# EasyEDA Pro project ProPrj_ROV_MINI_CTRL_2026-11-13.epro, board ROV_MINI_CTRL_V2.0.0
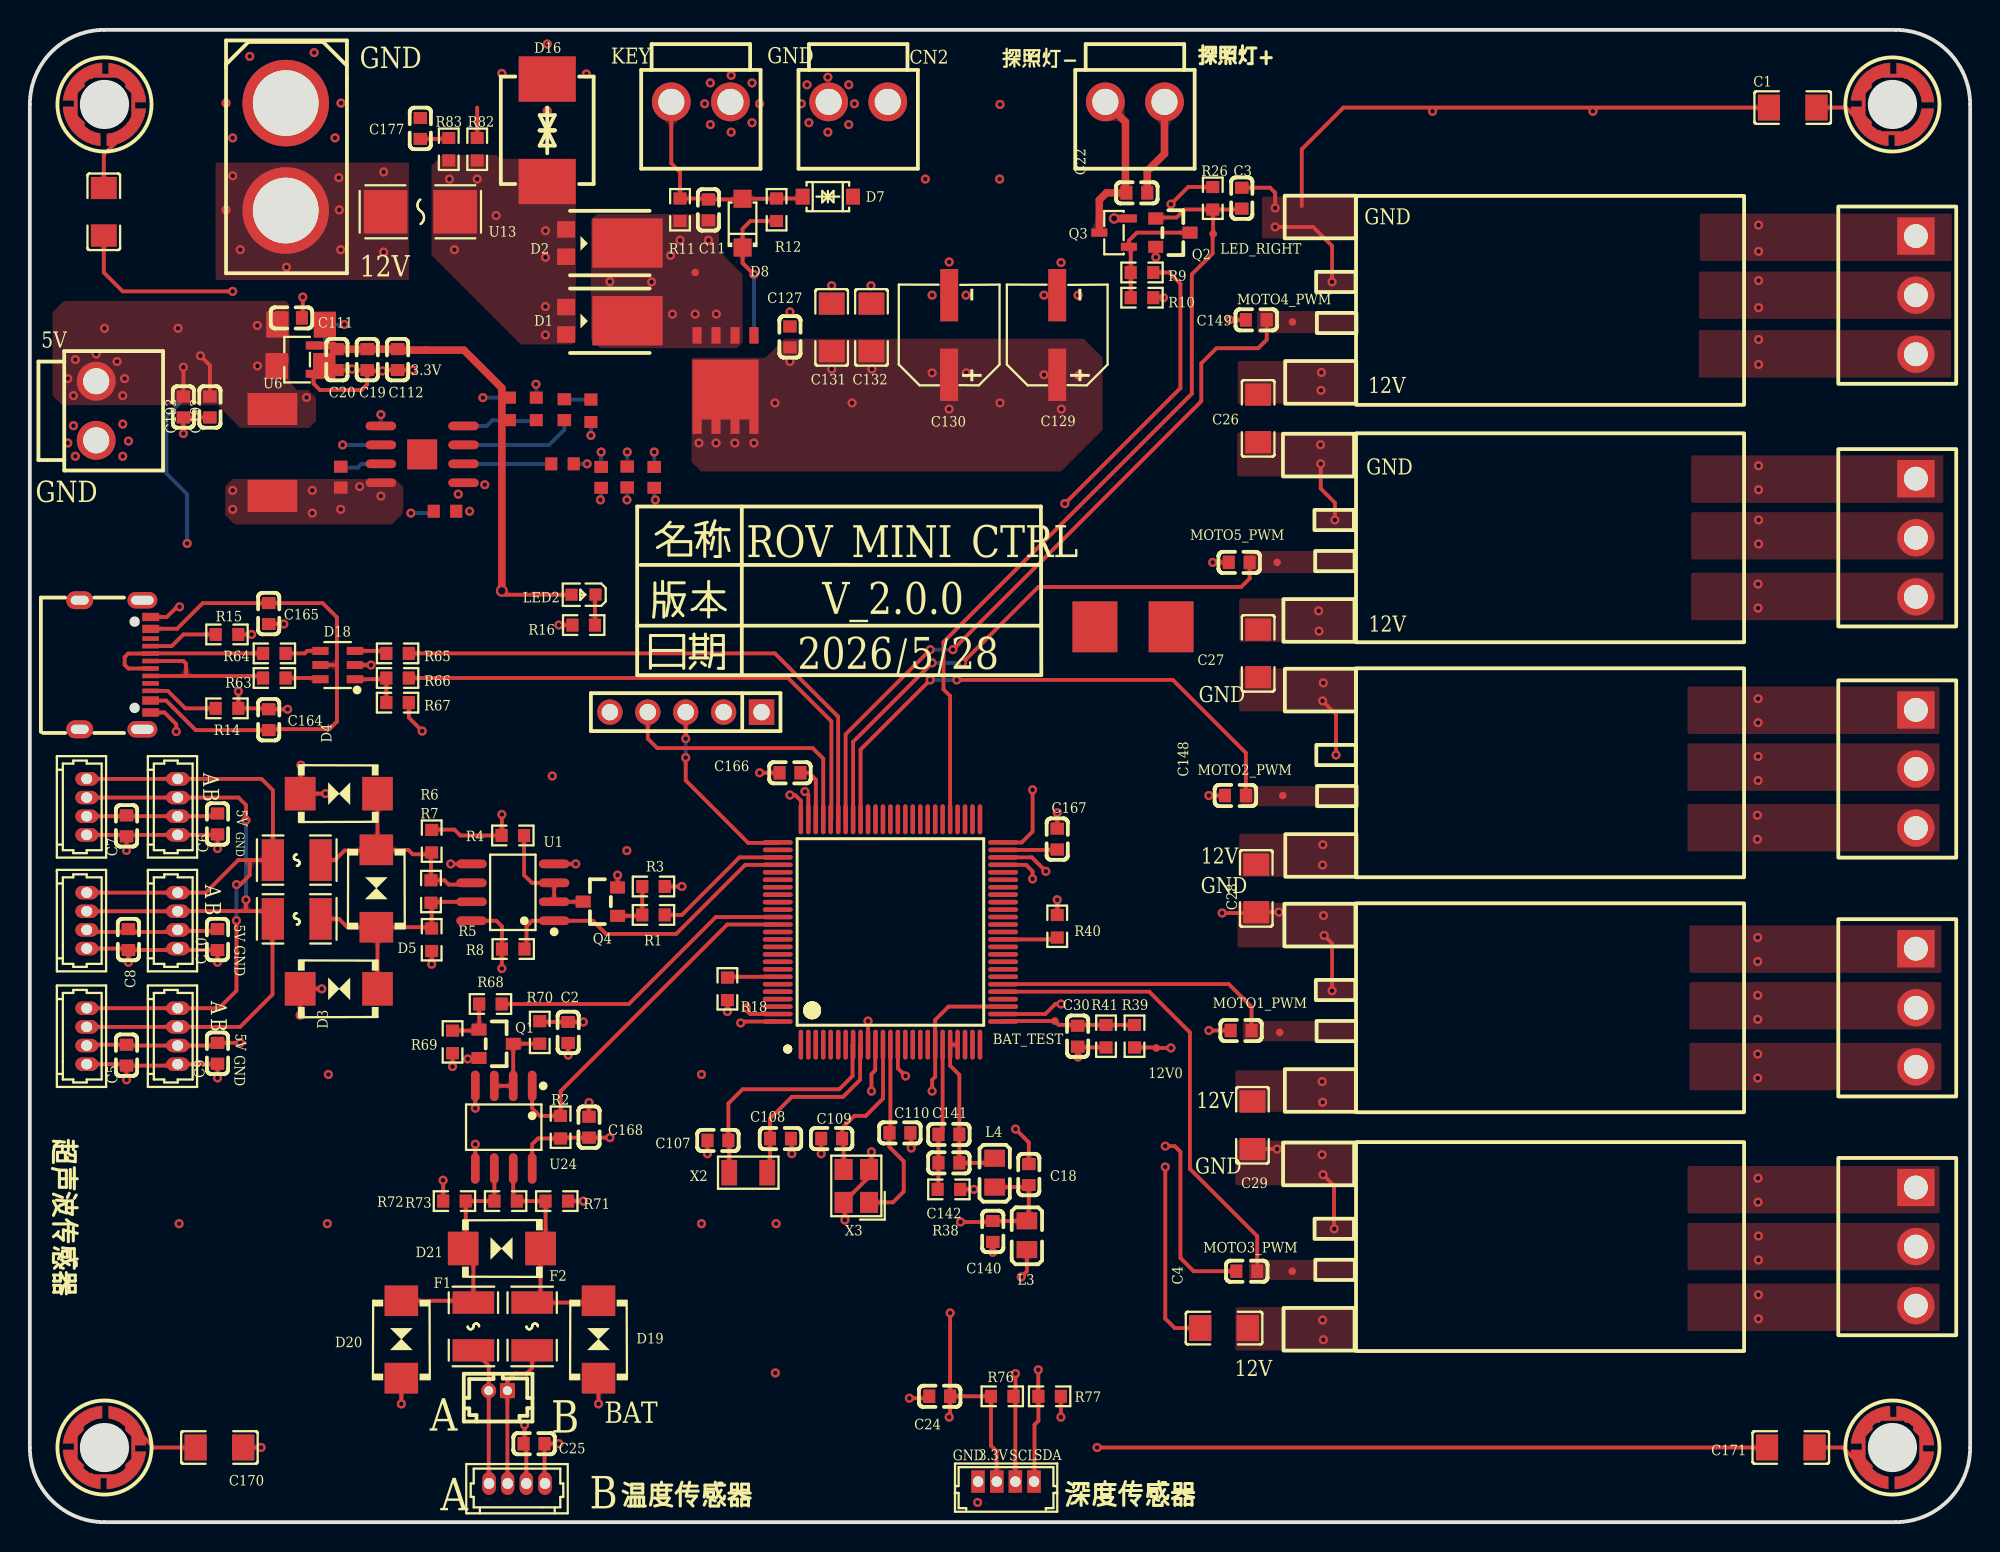
[diagram p14: board, top side]
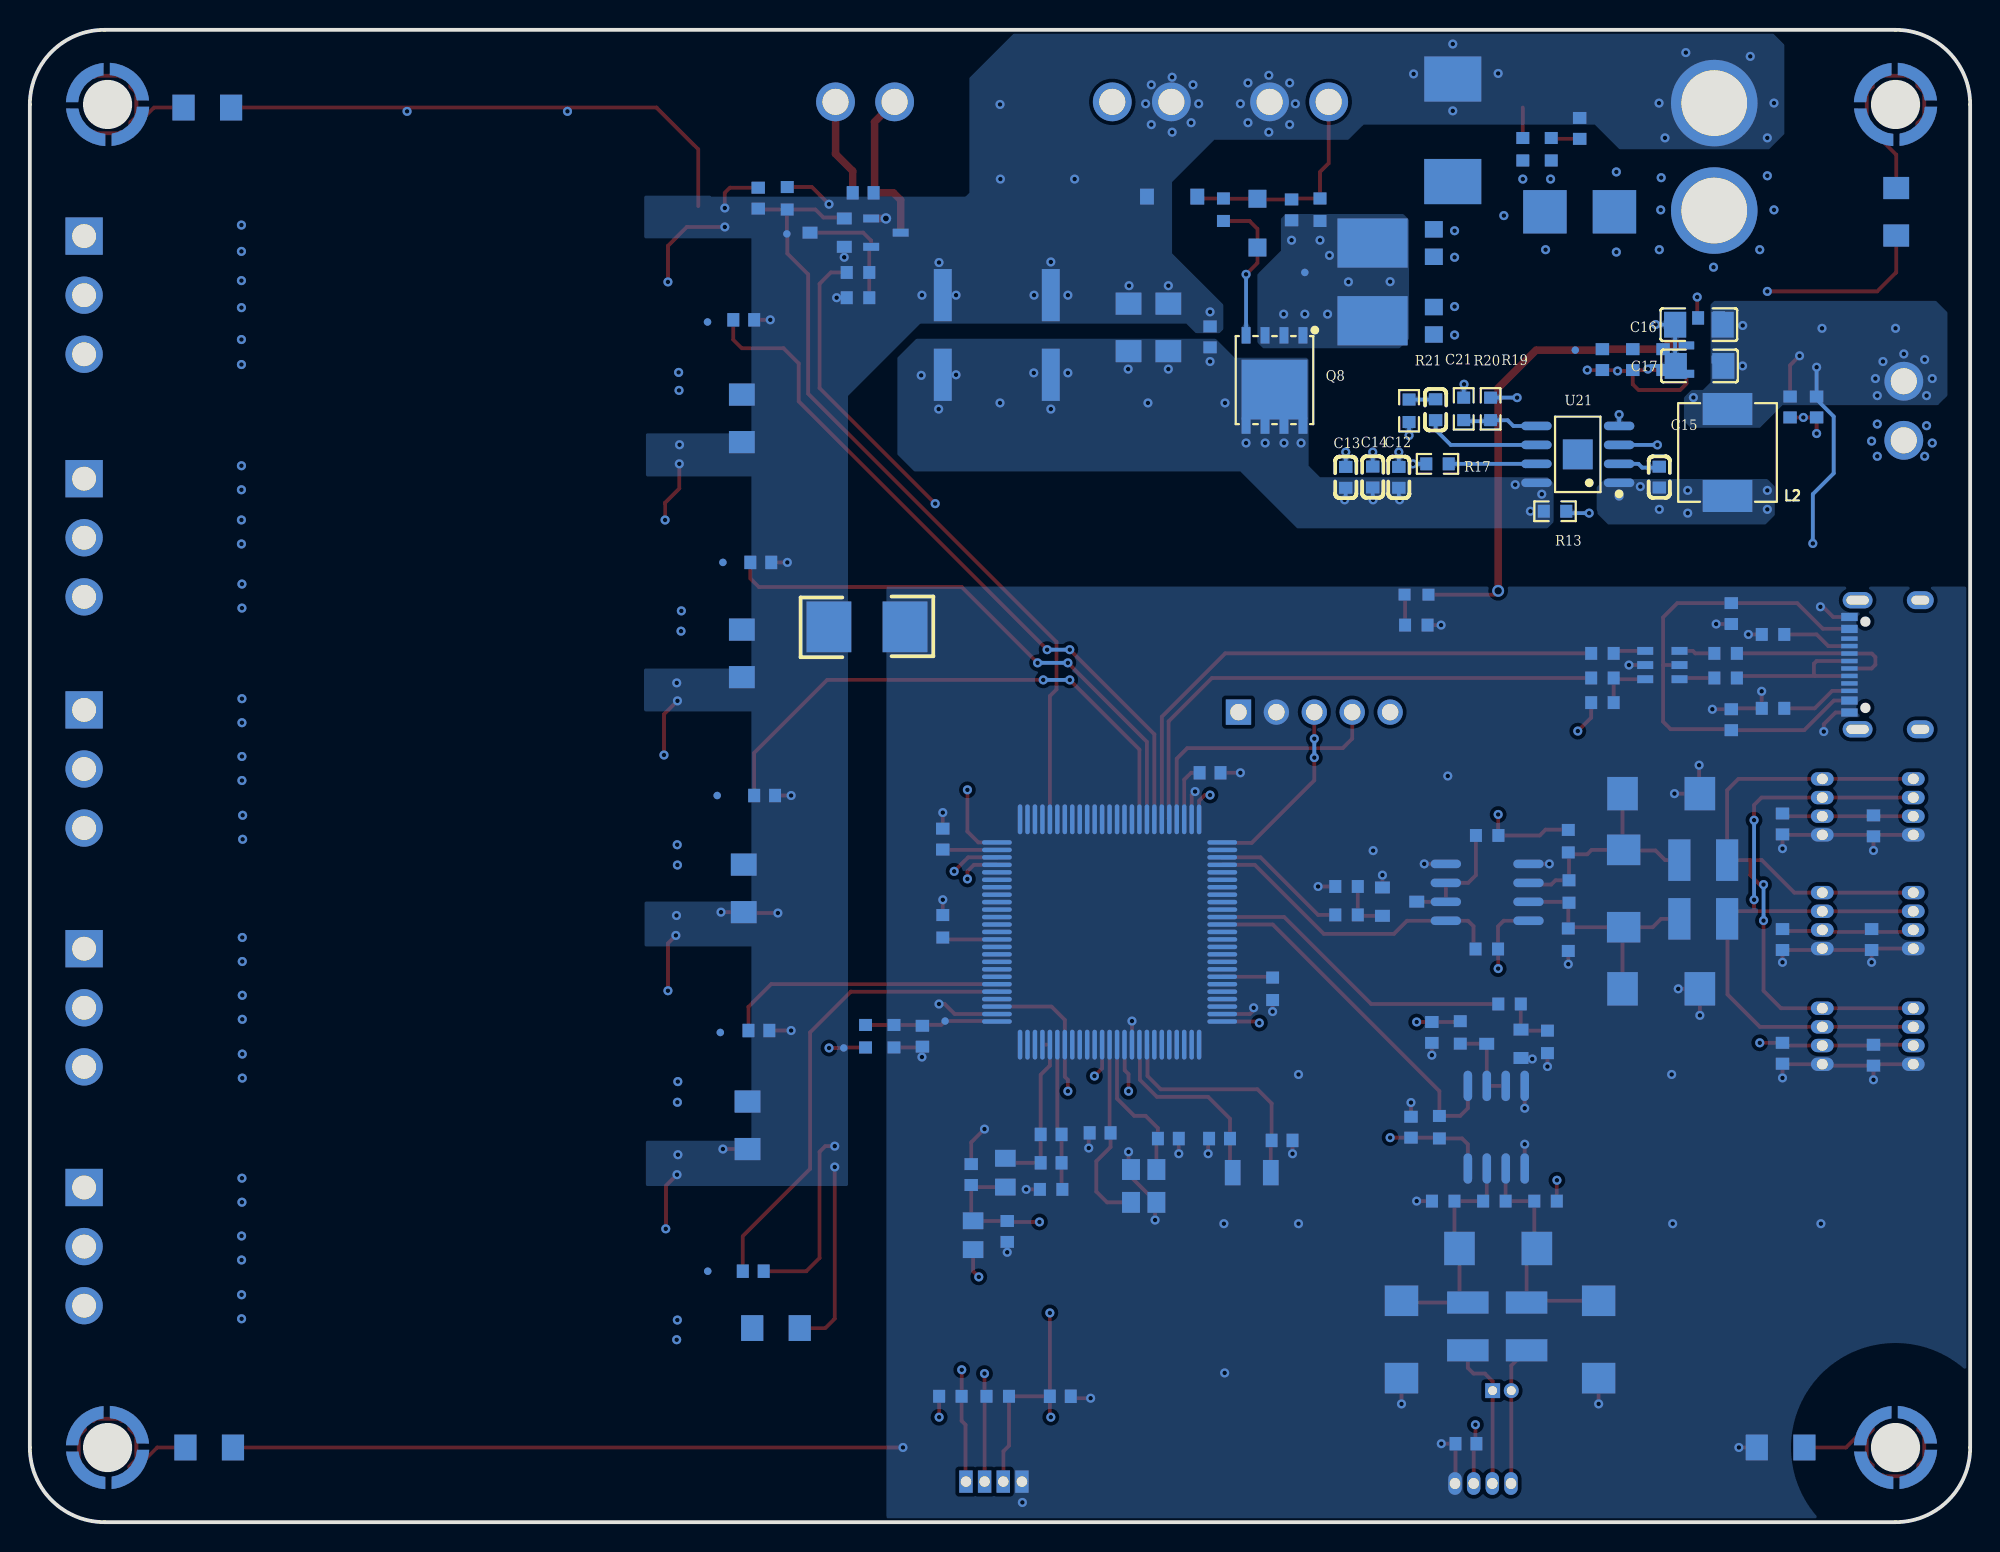
[diagram p15: board, bottom side, seen from below]

Outline 130 x 100 mm; copper layers: Top Layer, Bottom Layer. Coordinates in mm from the lower left corner of the outline.
Outline path: 0,95 0,5 arc(1.46,1.46) 5,0 125,0 arc(128.54,1.46) 130,5 130,95 arc(128.54,98.54) 125,100 5,100 arc(1.46,98.54) 0,95
Stack: Top Layer 0.035mm / Dielectric1 1.51mm FR4 er 4.5 / Bottom Layer 0.035mm

## Design rules (mm)
spacing copperThickness1oz (default): track to track 0.102, other pairs 0.152 to 0.3
spacing copperThickness2oz: track to track 0.203, other pairs 0.152 to 0.3
spacing Plane_innerPlane: track to track 0.102, other pairs 0.152 to 0.3
spacing Copper_copperRegion: track to track 0.102, other pairs 0.152 to 0.3
track width copperThickness1oz (default): min 0.127, default 0.254, max 2.54
track width copperThickness2oz: min 0.203, default 0.254, max 2.54
differential pair differentialPair (default): width min 0.127, default 0.254, max 2.54; gap min 0.152, default 0.152
net class GND uses Copper_copperRegion, Plane_innerPlane
net 3V3 uses Copper_copperRegion, Plane_innerPlane
net 5V0 uses Copper_copperRegion, Plane_innerPlane
net 12V0_IN uses Copper_copperRegion, Plane_innerPlane
net GND uses Copper_copperRegion, Plane_innerPlane
net 3V3_MCU uses Copper_copperRegion, Plane_innerPlane
net MOTO1_PWM_TIM3_CH1 uses Copper_copperRegion, Plane_innerPlane
net MOTO3_PWM_TIM2_CH1 uses Copper_copperRegion, Plane_innerPlane
net NRST uses Copper_copperRegion, Plane_innerPlane
net SWCLK uses Copper_copperRegion, Plane_innerPlane
net SWDIO uses Copper_copperRegion, Plane_innerPlane
net VDDA uses Copper_copperRegion, Plane_innerPlane
net PD6_UART2_RX_BAT uses Copper_copperRegion, Plane_innerPlane
net PD5_UART2_TX_BAT uses Copper_copperRegion, Plane_innerPlane
net OTG_FS_DP uses Copper_copperRegion, Plane_innerPlane
net OTG_FS_DM uses Copper_copperRegion, Plane_innerPlane
net MOTO5_PWM_TIM1_CH2 uses Copper_copperRegion, Plane_innerPlane
net MOTO2_PWM_TIM1_CH1 uses Copper_copperRegion, Plane_innerPlane
net RSTN uses Copper_copperRegion, Plane_innerPlane
net DRDY uses Copper_copperRegion, Plane_innerPlane
net $7N447 uses Copper_copperRegion, Plane_innerPlane
net $7N1099 uses Copper_copperRegion, Plane_innerPlane
net 5VUSB uses Copper_copperRegion, Plane_innerPlane
net BAT_A uses Copper_copperRegion, Plane_innerPlane
net BAT_B uses Copper_copperRegion, Plane_innerPlane
net $5N5769 uses Copper_copperRegion, Plane_innerPlane
net $5N5773 uses Copper_copperRegion, Plane_innerPlane
net $5N5566 uses Copper_copperRegion, Plane_innerPlane
net $5N5491 uses Copper_copperRegion, Plane_innerPlane
net $6N1333 uses Copper_copperRegion, Plane_innerPlane
net $6N1784 uses Copper_copperRegion, Plane_innerPlane
net $6N582 uses Copper_copperRegion, Plane_innerPlane
net $6N719 uses Copper_copperRegion, Plane_innerPlane
net $5N2875 uses Copper_copperRegion, Plane_innerPlane
net $5N2878 uses Copper_copperRegion, Plane_innerPlane
net $7N2109 uses Copper_copperRegion, Plane_innerPlane
net $7N2149 uses Copper_copperRegion, Plane_innerPlane
net $6N3154 uses Copper_copperRegion, Plane_innerPlane
net $6N3161 uses Copper_copperRegion, Plane_innerPlane
net $6N3166 uses Copper_copperRegion, Plane_innerPlane
net I2C2_SDA uses Copper_copperRegion, Plane_innerPlane
net I2C2_SCL uses Copper_copperRegion, Plane_innerPlane
net $8N1202 uses Copper_copperRegion, Plane_innerPlane
net $8N1351 uses Copper_copperRegion, Plane_innerPlane
net $8N1499 uses Copper_copperRegion, Plane_innerPlane
net $8N1306 uses Copper_copperRegion, Plane_innerPlane
net 12V0 uses copperRegion_copperThickness1oz
pour e565 uses Copper_copperRegion, copperRegion_Copper_copperRegion
pour e567 uses Copper_copperRegion, copperRegion_Copper_copperRegion
pour e569 uses Copper_copperRegion, copperRegion_Copper_copperRegion
pour e571 uses Copper_copperRegion, copperRegion_Copper_copperRegion
pour e600 uses Copper_copperRegion, copperRegion_Copper_copperRegion
pour e601 uses Copper_copperRegion, copperRegion_Copper_copperRegion
pour e603 uses Copper_copperRegion, copperRegion_Copper_copperRegion
pour e605 uses Copper_copperRegion, copperRegion_Copper_copperRegion
pour e606 uses Copper_copperRegion, copperRegion_Copper_copperRegion
pour e608 uses Copper_copperRegion, copperRegion_Copper_copperRegion
net SENSOR_B uses copperRegion_copperThickness1oz
pour e1149 uses Copper_copperRegion, copperRegion_Copper_copperRegion
pour e1155 uses Copper_copperRegion, copperRegion_Copper_copperRegion
pour e1157 uses Copper_copperRegion, copperRegion_Copper_copperRegion
pour e1198 uses Copper_copperRegion, copperRegion_Copper_copperRegion
pour e1200 uses Copper_copperRegion, copperRegion_Copper_copperRegion
pour e1312 uses Copper_copperRegion, copperRegion_Copper_copperRegion
pour e1326 uses Copper_copperRegion, copperRegion_Copper_copperRegion
pour e1328 uses Copper_copperRegion, copperRegion_Copper_copperRegion
pour e1330 uses Copper_copperRegion, copperRegion_Copper_copperRegion
pour e1384 uses Copper_copperRegion, copperRegion_Copper_copperRegion
pour e1386 uses Copper_copperRegion, copperRegion_Copper_copperRegion
pour e1392 uses Copper_copperRegion, copperRegion_Copper_copperRegion
pour e1394 uses Copper_copperRegion, copperRegion_Copper_copperRegion
pour e1396 uses Copper_copperRegion, copperRegion_Copper_copperRegion
pour e1398 uses Copper_copperRegion, copperRegion_Copper_copperRegion
pour e1603 uses Copper_copperRegion, copperRegion_Copper_copperRegion
pour e1871 uses Copper_copperRegion, copperRegion_Copper_copperRegion
pour e1891 uses Copper_copperRegion, copperRegion_Copper_copperRegion
pour e1918 uses Copper_copperRegion, copperRegion_Copper_copperRegion
pour e1932 uses Copper_copperRegion, copperRegion_Copper_copperRegion
pour e1959 uses Copper_copperRegion, copperRegion_Copper_copperRegion
pour e1972 uses Copper_copperRegion, copperRegion_Copper_copperRegion
pour e1974 uses Copper_copperRegion, copperRegion_Copper_copperRegion

## Placement (name value [footprint] x y rotation side)
3.3V  -  [Test-Point-0.5mm]  26.46 78.54 270 top
12V0  -  [Test-Point-0.5mm]  75.47 31.78 270 top
12V0_IN  -  [Test-Point-0.5mm]  44.58 83.74 0 top
BAT_TEST  -  [Test-Point-0.5mm]  68.68 33.58 270 top
C1  1nF  [C1206]  118.11 94.79 0 top
C2  100nF  [C0603]  36.07 32.82 90 top
C3  100nF  [C0603]  81.2 88.72 270 top
C4  330uF  [C1206]  80.01 13 0 top
C5  100nF  [C0603]  6.48 31.29 90 top
C6  100nF  [C0603]  12.57 46.79 90 top
C7  100nF  [C0603]  6.48 46.66 90 top
C8  100nF  [C0603]  6.6 39.04 90 top
C9  100nF  [C0603]  12.57 31.42 90 top
C10  100nF  [C0603]  12.57 39.04 90 top
C11  4.7uF  [C0603]  45.47 87.94 270 top
C12  10uF  [C0603]  38.28 70.01 270 bottom
C13  10uF  [C0603]  41.83 70.01 270 bottom
C14  100nF  [C0603]  40.03 70.03 270 bottom
C15  100nF  [C0603]  20.83 70.03 90 bottom
C16  22uF  [C1206]  18.17 80.24 180 bottom
C17  22uF  [C1206]  18.13 77.48 180 bottom
C18  10uF  [C0603]  66.93 23.29 270 top
C19  10uF  [C0603]  22.61 77.9 270 top
C20  100nF  [C0603]  20.57 77.9 270 top
C21  2.7nF  [C0603]  35.81 74.54 270 bottom
C22  100nF  [C0603]  74.17 89.08 0 top
C24  4.7uF  [C0603]  60.96 8.43 0 top
C25  100nF  [C0603]  33.78 5.26 180 top
C26  100uF  [C1206]  82.3 73.97 90 top
C27  22uF  [C1206]  82.3 58.22 90 top
C28  1nF  [C1206]  82.17 42.47 90 top
C29  100nF  [C1206]  81.91 26.59 90 top
C30  100nF  [C0603]  70.2 32.56 90 top
C107  12pF  [C0603]  46.1 25.58 180 top
C108  12pF  [C0603]  50.29 25.71 0 top
C109  20pF  [C0603]  53.72 25.71 0 top
C110  20pF  [C0603]  58.29 26.09 180 top
C111  1uF  [C0603]  17.53 80.7 180 top
C112  1uF  [C0603]  24.64 77.9 90 top
C127  100nF  [C0603]  50.93 79.43 270 top
C129  220uF  [CAP-SMD_BD6.3-L6.6-W6.6-LS7.2-FD]  68.83 79.55 90 top
C130  220uF  [CAP-SMD_BD6.3-L6.6-W6.6-LS7.2-FD]  61.59 79.55 90 top
C131  22uF  [C1206]  53.72 80.06 270 top
C132  22uF  [C1206]  56.39 80.06 270 top
C140  100nF  [C0603]  64.52 19.48 90 top
C141  100nF  [C0603]  61.58 25.98 0 top
C142  10uF  [C0603]  61.58 24.08 0 top
C145  100nF  [C0603]  81.53 16.81 0 top
C146  100nF  [C0603]  81.15 32.94 0 top
C147  100nF  [C0603]  81.03 64.31 0 top
C148  100nF  [C0603]  80.77 48.69 0 top
C149  100nF  [C0603]  82.17 80.57 0 top
C164  100nF  [C0603]  16 53.77 270 top
C165  10uF  [C0603]  16 60.88 90 top
C166  2.2uF  [C0603]  50.93 50.22 180 top
C167  2.2uF  [C0603]  68.83 45.77 90 top
C168  100nF  [C0603]  37.47 26.47 270 top
C169  1nF  [C1206]  4.95 87.81 90 top
C170  1nF  [C1206]  12.7 5 180 top
C171  1nF  [C1206]  117.98 5 0 top
C177  220nF  [C0603]  26.16 93.4 270 top
C192  10uF  [C0603]  12.06 74.73 90 top
C193  100nF  [C0603]  10.29 74.73 270 top
CN1  LAIL-PHC3.96-2P-01-VH-L  [CONN-TH_2P-P3.96_C9900035759]  44.96 95.17 0 top
CN2  LAIL-PHC3.96-2P-01-VH-L  [CONN-TH_2P-P3.96_C9900035759]  55.5 95.17 0 top
CN3  WAFER-MX1.25-2PZZ  [CONN-TH_2P-P3.96_C9900035759]  74.04 95.17 0 top
CN12  WAFER-MX1.25-2PZZ  [CONN-TH_2P-P1.25-V-M_721]  31.37 8.81 0 top
CN22  VH3.96-2P ZZ  [CONN-TH_2P-P3.96_C9900035759]  4.44 74.47 90 top
D1  SB1045L  [TO-277_3P-L5.4-W4.0-LS6.5-TR]  37.99 80.51 180 top
D2  SB1045L  [TO-277_3P-L5.4-W4.0-LS6.5-TR]  37.99 85.71 180 top
D3  P6SMB6.8CA  [SMB_L4.3-W3.6-LS5.4-BI]  20.7 35.74 180 top
D4  P6SMB6.8CA  [SMB_L4.3-W3.6-LS5.4-BI]  20.7 48.82 180 top
D5  P6SMB6.8CA  [SMB_L4.3-W3.6-LS5.4-BI]  23.22 42.46 270 top
D7  PESD24VL1BA  [SOD-123_L2.8-W1.8-LS3.7-BI]  53.47 88.82 0 top
D8  5.0SMDJ30A  [SOD-123FL_L2.7-W1.8-LS3.8-RD]  47.75 87.05 90 top
D16  5.0SMDJ15CA  [SMC_L6.9-W5.9-LS7.9-BI]  34.66 93.27 270 top
D18  USBLC6-2SC6  [SOT-23-6_L2.9-W1.6-P0.95-LS2.8-BL]  20.62 57.44 90 top
D19  P6SMB6.8CA  [SMB_L4.3-W3.6-LS5.4-BI]  38.1 12.24 270 top
D20  P6SMB6.8CA  [SMB_L4.3-W3.6-LS5.4-BI]  24.89 12.24 270 top
D21  P6SMB6.8CA  [SMB_L4.3-W3.6-LS5.4-BI]  31.62 18.34 0 top
F1  MF-USMF010-2  [F1210]  29.72 13.12 270 top
F2  MF-USMF010-2  [F1210]  33.66 13.12 270 top
F3  MF-USMF010-2  [F1210]  17.88 44.36 180 top
F4  MF-USMF010-2  [F1210]  17.88 40.43 180 top
H1  LAIL-PZ2.54-4P-L  [HDR-TH_5P-P2.54-V-M]  43.94 54.28 180 top
L2  10uH  [IND-SMD_L7.1-W6.6]  16.26 71.68 90 bottom
L3  CBW201209U301T  [L0805]  66.8 19.23 90 top
L4  CBW201209U301T  [L0805]  64.64 23.42 90 top
LED2  XL-1608SURC-06  [LED0603-RD_RED]  37.09 62.15 180 top
LED_RIGHT  -  [Test-Point-0.5mm]  79.28 86.33 90 top
MOTO1_PWM  -  [Test-Point-0.5mm]  83.74 32.81 0 top
MOTO2_PWM  -  [Test-Point-0.5mm]  83.95 48.69 0 top
MOTO3_PWM  -  [Test-Point-0.5mm]  84.58 16.81 0 top
MOTO4_PWM  -  [Test-Point-0.5mm]  84.6 80.42 90 top
MOTO5_PWM  -  [Test-Point-0.5mm]  83.57 64.31 0 top
Q1  SS8050  [SOT-23_L2.9-W1.3-P1.90-LS2.4-BR]  31.24 32.06 180 top
Q2  SS8050  [SOT-23_L2.9-W1.3-P1.90-LS2.4-BR]  76.58 86.41 180 top
Q3  HL2312  [SOT-23-3_L2.9-W1.3-P1.90-LS2.3-BR]  72.64 86.41 0 top
Q4  SS8050  [SOT-23_L2.9-W1.3-P1.90-LS2.4-BR]  38.23 41.58 0 top
Q8  XR60P03F  [DFN5X6-8_L5.9-W5.2-P1.27-LS6.2-BL-EP]  46.61 76.5 0 bottom
R1  1kΩ  [R0603]  41.78 40.69 180 top
R2  4.7kΩ  [R0603]  35.56 26.47 270 top
R3  4.7kΩ  [R0603]  41.78 42.6 180 top
R4  4.7kΩ  [R0603]  32.36 46.01 0 top
R5  4.7kΩ  [R0603]  26.92 39.03 270 top
R6  4.7kΩ  [R0603]  26.92 45.63 90 top
R7  120Ω  [R0603]  26.88 42.26 270 top
R8  10kΩ  [R0603]  32.39 38.41 180 top
R9  10K  [R0603]  74.51 83.74 0 top
R10  10K  [R0603]  74.51 82.05 0 top
R11  3.6nF@1kHz  [R0603]  43.56 87.95 270 top
R12  3R3  [R0603]  50.03 87.95 270 top
R13  100K  [R0603]  27.81 67.74 0 bottom
R14  47K  [R0603]  13.21 54.53 180 top
R15  100K  [R0603]  13.21 59.49 180 top
R16  1kΩ  [R0603]  37.11 60.11 0 top
R17  137K  [R0603]  35.69 70.92 0 bottom
R18  4.7kΩ  [R0603]  46.74 35.74 90 top
R19  150K  [R0603]  32.13 74.6 90 bottom
R20  28.7K  [R0603]  33.93 74.6 270 bottom
R21  24K  [R0603]  37.59 74.47 90 bottom
R26  10K  [R0603]  79.26 88.71 270 top
R37  10K  [RES-SMD_L6.4-W3.2-A]  73.91 60 0 bottom
R38  0Ω  [R0603]  61.58 22.3 180 top
R39  100K  [R0603]  74.01 32.56 270 top
R40  4.7kΩ  [R0603]  68.83 39.93 270 top
R41  27k  [R0603]  72.1 32.56 90 top
R63  33Ω  [R0603]  16.38 56.57 180 top
R64  33Ω  [R0603]  16.38 58.22 0 top
R65  33Ω  [R0603]  24.64 58.22 180 top
R66  33Ω  [R0603]  24.64 56.57 180 top
R67  10kΩ  [R0603]  24.64 54.92 0 top
R68  1kΩ  [R0603]  30.86 34.72 180 top
R69  4.7kΩ  [R0603]  28.32 32.18 90 top
R70  4.7kΩ  [R0603]  34.16 32.82 270 top
R71  4.7kΩ  [R0603]  35.31 21.51 0 top
R72  4.7kΩ  [R0603]  28.45 21.51 180 top
R73  120Ω  [R0603]  31.88 21.51 0 top
R76  10kΩ  [R0603]  65.15 8.43 180 top
R77  10kΩ  [R0603]  68.33 8.43 0 top
R82  649kΩ  [R0603]  29.97 92 270 top
R83  3.3Ω  [R0603]  28.07 92 270 top
U1  MAX3485ESA(UMW)  [SOP-8_L5.0-W4.0-P1.27-LS6.0-BL]  32.36 42.2 90 top
U2  XT60-M.  [CONN-TH_XT60]  17.14 91.49 270 top
U3  500kHz  [CONN-TH_4P-P1.25_WAFER-MX1.25-4PZZ]  65.41 2.72 0 top
U4  ZX-MX1.25-4PZZ  [CONN-TH_4P-P1.25_MEGASTAR_ZX-MX1.25-4PZZ]  32.64 2.59 0 top
U5  ZX-MX1.25-4PZZ  [CONN-TH_4P-P1.25_MEGASTAR_ZX-MX1.25-4PZZ]  3.81 47.93 270 top
U6  XC6206P332MR  [SOT-23-3_L3.0-W1.7-P0.95-LS2.9-BR]  17.91 77.9 0 top
U7  ZX-MX1.25-4PZZ  [CONN-TH_4P-P1.25_MEGASTAR_ZX-MX1.25-4PZZ]  3.81 40.31 270 top
U8  ZX-MX1.25-4PZZ  [CONN-TH_4P-P1.25_MEGASTAR_ZX-MX1.25-4PZZ]  9.91 40.31 270 top
U9  ZX-MX1.25-4PZZ  [CONN-TH_4P-P1.25_MEGASTAR_ZX-MX1.25-4PZZ]  3.81 32.56 270 top
U10  ZX-MX1.25-4PZZ  [CONN-TH_4P-P1.25_MEGASTAR_ZX-MX1.25-4PZZ]  9.91 47.93 270 top
U11  ZX-MX1.25-4PZZ  [CONN-TH_4P-P1.25_MEGASTAR_ZX-MX1.25-4PZZ]  9.91 32.56 270 top
U13  MM1Z5V1B  [FUSE-SMD_L6.1-W2.7]  26.16 87.81 0 top
U14  XY-VH3.96-3A11  [CONN-TH_3P-P3.96_XYECONN_XY-VH3.96-3A11]  126.37 82.22 270 top
U15  XY-VH3.96-3A11  [CONN-TH_3P-P3.96_XYECONN_XY-VH3.96-3A11]  126.37 65.96 270 top
U16  XY-VH3.96-3A11  [CONN-TH_3P-P3.96_XYECONN_XY-VH3.96-3A11]  126.37 50.47 270 top
U17  XY-VH3.96-3A11  [CONN-TH_3P-P3.96_XYECONN_XY-VH3.96-3A11]  126.37 34.47 270 top
U18  XY-VH3.96-3A11  [CONN-TH_3P-P3.96_XYECONN_XY-VH3.96-3A11]  126.37 18.47 270 top
U19  STM32F407VET6  [LQFP-100_L14.0-W14.0-P0.50-LS16.0-BL]  57.66 39.55 0 top
U21  RT7272BGSP  [SOIC-8_L5.0-W4.0-P1.27-LS6.0-BL-EP2.0]  26.29 71.55 90 bottom
U24  MAX3485ESA(UMW)  [SOP-8_L5.0-W4.0-P1.27-LS6.0-BL]  31.75 26.47 180 top
U25  R30-1000602-Harwin  [SMD_BD5.0-D3.0]  5 95 0 top
U26  R30-1000602-Harwin  [SMD_BD5.0-D3.0]  5 5 0 top
U27  R30-1000602-Harwin  [SMD_BD5.0-D3.0]  124.79 5 0 top
U28  R30-1000602-Harwin  [SMD_BD5.0-D3.0]  124.79 95 0 top
USB1  TYPE-C 16PIN 2MD(073)  [USB-C-SMD_TYPE-C-6PIN-2MD-073]  5.72 57.45 270 top
X2  32.768kHz  [CRYSTAL-SMD_L3.2-W1.5-1]  48.13 23.42 180 top
X3  8MHz  [CRYSTAL-SMD_4P-L3.2-W2.5-BL]  55.37 22.53 90 top

## Footprints (pads in the part's own frame, mm; a bottom-side part is the same pattern mirrored in y, then rotated)
C0603
  rect 0.8x0.9 hole 0.001: 1(-0.7,0) 2(0.7,0)
C1206
  rect 1.485x1.728 hole 0.001: 1(-1.593,0) 2(1.593,0)
CAP-SMD_BD6.3-L6.6-W6.6-LS7.2-FD
  rect 3.5x1.2 hole 0.001: 1(-2.67,0) 2(2.67,0)
CONN-TH_2P-P1.25-V-M_721
  rect 1x1 hole 0.6: 1(0.625,0)
  round 1 hole 0.6: 2(-0.625,0)
CONN-TH_2P-P3.96_C9900035759
  round 2.6 hole 1.75: 1(-1.98,0) 2(1.98,0)
CONN-TH_3P-P3.96_XYECONN_XY-VH3.96-3A11
  rect 2.5x2.5 hole 1.6: 1(-3.96,0)
  round 2.5 hole 1.6: 2(0,0) 3(3.96,0)
CONN-TH_4P-P1.25_MEGASTAR_ZX-MX1.25-4PZZ
  oval 0.9x1.524 hole 0.7x0.735: 1(-1.875,0) 2(-0.625,0) 3(0.625,0) 4(1.875,0)
CONN-TH_4P-P1.25_WAFER-MX1.25-4PZZ
  rect 0.9x1.5 hole 0.7: 1(1.875,0) 2(0.625,0) 3(-0.625,0) 4(-1.875,0)
CONN-TH_XT60
  round 5.8 hole 4.4: 1(-3.6,0) 2(3.6,0)
CRYSTAL-SMD_4P-L3.2-W2.5-BL
  rect 1.4x1.2 hole 0.001: 1(-1.1,-0.85) 2(1.1,-0.85) 3(1.1,0.85) 4(-1.1,0.85)
CRYSTAL-SMD_L3.2-W1.5-1
  rect 1.05x1.7 hole 0.001: 1(-1.275,0) 2(1.275,0)
DFN5X6-8_L5.9-W5.2-P1.27-LS6.2-BL-EP
  rect 0.6x1.1 hole 0.001: 1(-1.905,-3.025) 2(-0.635,-3.025) 3(0.635,-3.025) 4(1.905,-3.025) 5(1.905,3.025) 6(0.635,3.025) 7(-0.635,3.025) 8(-1.905,3.025)
  rect 4.41x4 hole 0.001: 9(0,0.61)
F1210
  rect 1.485x2.781 hole 0.001: 1(-1.6,0) 2(1.6,0)
FUSE-SMD_L6.1-W2.7
  rect 2.91x2.905 hole 0.001: 1(-2.33,0) 2(2.33,0)
HDR-TH_5P-P2.54-V-M
  rect 1.7x1.7 hole 1.1: 1(-5.08,0)
  round 1.7 hole 1.1: 2(-2.54,0) 3(0,0) 4(2.54,0) 5(5.08,0)
IND-SMD_L7.1-W6.6
  rect 2.15x3.32 hole 0.001: 1(-2.913,0) 2(2.913,0)
L0805
  rect 1.133x1.377 hole 0.001: 1(-0.966,0) 2(0.966,0)
LED0603-RD_RED
  rect 0.8x0.8 hole 0.001: 1(-0.799,-0.004) 2(0.799,0.004)
LQFP-100_L14.0-W14.0-P0.50-LS16.0-BL
  oval 0.3x2 hole 0.001: 1(-6,-7.55) 2(-5.5,-7.55) 3(-5,-7.55) 4(-4.5,-7.55) 5(-4,-7.55) 6(-3.5,-7.55) 7(-3,-7.55) 8(-2.5,-7.55) 9(-2,-7.55) 10(-1.5,-7.55) 11(-1,-7.55) 12(-0.5,-7.55) 13(0,-7.55) 14(0.5,-7.55) 15(1,-7.55) 16(1.5,-7.55) 17(2,-7.55) 18(2.5,-7.55) 19(3,-7.55) 20(3.5,-7.55) 21(4,-7.55) 22(4.5,-7.55) 23(5,-7.55) 24(5.5,-7.55) 25(6,-7.55) 51(6,7.55) 52(5.5,7.55) 53(5,7.55) 54(4.5,7.55) 55(4,7.55) 56(3.5,7.55) 57(3,7.55) 58(2.5,7.55) 59(2,7.55) 60(1.5,7.55) 61(1,7.55) 62(0.5,7.55) 63(0,7.55) 64(-0.5,7.55) 65(-1,7.55) 66(-1.5,7.55) 67(-2,7.55) 68(-2.5,7.55) 69(-3,7.55) 70(-3.5,7.55) 71(-4,7.55) 72(-4.5,7.55) 73(-5,7.55) 74(-5.5,7.55) 75(-6,7.55)
  oval 2x0.3 hole 0.001: 26(7.55,-6) 27(7.55,-5.5) 28(7.55,-5) 29(7.55,-4.5) 30(7.55,-4) 31(7.55,-3.5) 32(7.55,-3) 33(7.55,-2.5) 34(7.55,-2) 35(7.55,-1.5) 36(7.55,-1) 37(7.55,-0.5) 38(7.55,0) 39(7.55,0.5) 40(7.55,1) 41(7.55,1.5) 42(7.55,2) 43(7.55,2.5) 44(7.55,3) 45(7.55,3.5) 46(7.55,4) 47(7.55,4.5) 48(7.55,5) 49(7.55,5.5) 50(7.55,6) 76(-7.55,6) 77(-7.55,5.5) 78(-7.55,5) 79(-7.55,4.5) 80(-7.55,4) 81(-7.55,3.5) 82(-7.55,3) 83(-7.55,2.5) 84(-7.55,2) 85(-7.55,1.5) 86(-7.55,1) 87(-7.55,0.5) 88(-7.55,0) 89(-7.55,-0.5) 90(-7.55,-1) 91(-7.55,-1.5) 92(-7.55,-2) 93(-7.55,-2.5) 94(-7.55,-3) 95(-7.55,-3.5) 96(-7.55,-4) 97(-7.55,-4.5) 98(-7.55,-5) 99(-7.55,-5.5) 100(-7.55,-6)
R0603
  rect 0.806x0.864 hole 0.001: 1(-0.753,0) 2(0.753,0)
RES-SMD_L6.4-W3.2-A
  rect 3x3.4 hole 0.001: 1(-2.55,0) 2(2.55,0)
SMB_L4.3-W3.6-LS5.4-BI
  rect 2.047x2.241 hole 0.001: 1(-2.591,0) 2(2.591,0)
SMC_L6.9-W5.9-LS7.9-BI
  rect 3.03x3.82 hole 0.001: 1(-3.435,0) 2(3.435,0)
SMD_BD5.0-D3.0
  custom 2.52x2.628 hole 0.001: 1(-1.529,-1.792) 1(1.529,1.792)
  custom 2.629x2.52 hole 0.001: 1(-1.466,1.847) 1(1.465,-1.847)
SOD-123_L2.8-W1.8-LS3.7-BI
  rect 0.93x1.06 hole 0.001: 1(1.685,0) 2(-1.685,0)
SOD-123FL_L2.7-W1.8-LS3.8-RD
  rect 1.2x1.2 hole 0.001: 1(-1.635,0) 2(1.635,0)
SOIC-8_L5.0-W4.0-P1.27-LS6.0-BL-EP2.0
  oval 0.574x2.038 hole 0.001: 1(-1.905,-2.769) 2(-0.635,-2.769) 3(0.635,-2.769) 4(1.905,-2.769) 5(1.905,2.769) 6(0.635,2.769) 7(-0.635,2.769) 8(-1.905,2.769)
  rect 2x2 hole 0.001: 9(0,0)
SOP-8_L5.0-W4.0-P1.27-LS6.0-BL
  oval 0.574x2.035 hole 0.001: 1(-1.905,-2.768) 2(-0.635,-2.768) 3(0.635,-2.768) 4(1.905,-2.768) 5(1.905,2.768) 6(0.635,2.768) 7(-0.635,2.768) 8(-1.905,2.768)
SOT-23-3_L2.9-W1.3-P1.90-LS2.3-BR
  rect 1.07x0.532 hole 0.001: 1(0.99,-0.95) 2(0.99,0.95) 3(-0.99,0)
SOT-23-3_L3.0-W1.7-P0.95-LS2.9-BR
  rect 1.038x0.532 hole 0.001: 1(1.101,-0.95) 2(1.101,0.95) 3(-1.101,0)
SOT-23-6_L2.9-W1.6-P0.95-LS2.8-BL
  rect 0.532x1.072 hole 0.001: 1(-0.95,-1.149) 2(0,-1.149) 3(0.95,-1.149) 4(0.95,1.149) 5(0,1.149) 6(-0.95,1.149)
SOT-23_L2.9-W1.3-P1.90-LS2.4-BR
  rect 1x0.8 hole 0.001: 1(1.15,-0.95) 2(1.15,0.95) 3(-1.15,0)
Test-Point-0.5mm
  round 0.5 hole 0.001: 1(0,0)
TO-277_3P-L5.4-W4.0-LS6.5-TR
  rect 1.2x1.1 hole 0.001: 1(2.054,0.92) 3(2.054,-0.92)
  rect 4.7x3.3 hole 0.001: 2(-2.054,0)
USB-C-SMD_TYPE-C-6PIN-2MD-073
  rect 0.55x1.1 hole 0.001: 1(-3.2,2.375) 2(-2.4,2.375) 11(2.4,2.375) 12(3.2,2.375)
  rect 0.3x1.1 hole 0.001: 3(-1.75,2.375) 4(-1.25,2.375) 5(-0.75,2.375) 6(-0.25,2.375) 7(0.25,2.375) 8(0.75,2.375) 9(1.25,2.375) 10(1.75,2.375)
  oval 1.1x2 hole 0.6x1.5: 13(-4.325,1.825) 14(4.325,1.825)
  oval 1.2x1.8 hole 0.6x1.2: 13(-4.325,-2.375) 14(4.325,-2.375)

## Nets
3V3: 3.3V.1 C2.2 C19.1 C20.1 C24.2 C112.2 C168.2 H1.5 L3.1 LED2.2 R2.2 R4.1 R6.2 R8.2 R67.2 R70.1 R72.2 R76.2 R77.2 U1.8 U3.3 U6.2 U19.50 U19.75 U24.8
3V3_MCU: C18.2 C140.2 L3.2 L4.1 U19.11 U19.19 U19.28 U19.100
5V0: C5.2 C6.2 C7.2 C8.2 C9.2 C10.2 C16.2 C17.2 C25.2 C111.2 C192.2 C193.1 CN22.2 L2.2 R9.2 R19.2 U4.3 U5.3 U6.3 U7.3 U8.3 U9.3 U10.3 U11.3
5VUSB: C164.2 C165.2 D18.5 USB1.2 USB1.11
12V0: 12V0.1 C4.2 C12.2 C13.2 C14.2 C22.2 C26.2 C27.2 C28.2 C29.2 C127.2 C129.1 C130.1 C131.2 C132.2 CN2.2 CN3.2 Q8.5 Q8.6 Q8.7 Q8.8 Q8.9 R13.2 R39.2 U21.8
12V0_IN: 12V0_IN.1 C11.2 D1.2 D2.2 Q8.1 Q8.2 Q8.3 R11.2
GND: C1.1 C2.1 C3.1 C4.1 C5.1 C6.1 C7.1 C8.1 C9.1 C10.1 C12.1 C13.1 C14.1 C16.1 C17.1 C18.1 C19.2 C20.2 C24.1 C25.1 C26.1 C27.1 C28.1 C29.1 C30.1 C107.2 C108.2 C109.1 C110.1 C111.1 C112.1 C127.1 C129.2 C130.2 C131.1 C132.1 C140.1 C145.1 C146.1 C147.1 C148.1 C149.1 C164.1 C165.1 C166.2 C167.2 C168.1 C169.1 C170.1 C171.1 C177.1 C192.1 C193.2 CN1.2 CN2.1 CN22.1 D3.2 D4.2 D7.1 D16.1 D18.2 D19.2 D20.2 H1.2 Q1.2 Q2.2 Q3.2 Q4.2 R3.1 R5.2 R10.2 R14.1 R15.1 R16.1 R17.2 R18.1 R20.1 R21.1 R26.1 R37.1 R37.2 R38.1 R40.1 R41.1 R69.1 R71.2 R82.1 U1.4 U1.5 U2.1 U3.4 U4.4 U5.4 U6.1 U7.4 U8.4 U9.4 U10.4 U11.4 U19.10 U19.27 U19.74 U19.99 U21.4 U21.9 U24.4 U24.5 USB1.1 USB1.12 X3.2 X3.4
V1: U14.2
V2: U16.2
V3: U18.2
V4: U15.2
V5: U17.2
VDDA: C141.2 C142.2 L4.2 U19.21 U19.22
BAT_A: CN12.2 F1.2 U4.1
BAT_ADC: BAT_TEST.1 C30.2 R39.1 R41.2 U19.26
BAT_B: CN12.1 F2.2 U4.2
DRDY: U19.3
I2C2_SCL: R76.1 U3.2 U19.47
I2C2_SDA: R77.1 U3.1 U19.48
KEY: C11.1 CN1.1 D7.2 D8.2 R11.1 R12.1
LED_R: C22.1 CN3.1 Q3.3
LED_RIGHT: C3.2 LED_RIGHT.1 Q2.1 R26.2 U19.55
MOTO1_PWM_TIM3_CH1: C146.2 MOTO1_PWM.1 U19.31
MOTO2_PWM_TIM1_CH1: C148.2 MOTO2_PWM.1 U19.67
MOTO3_PWM_TIM2_CH1: C145.2 MOTO3_PWM.1 U19.30
MOTO4_PWM_TIM1_CH3: C149.2 MOTO4_PWM.1 U19.69
MOTO5_PWM_TIM1_CH2: C147.2 MOTO5_PWM.1 U19.68
MOTO_LEFT: U19.53
MOTO_RIGHT: U19.52
NRST: H1.1 U19.14
OTG_FS_DM: R65.1 U19.70
OTG_FS_DP: R66.1 U19.71
PC10_UART4_TX: R1.1 U19.78
PC11_UART4_RX: R8.1 U1.1 U19.79
PD5_UART2_TX_BAT: R68.1 U19.86
PD6_UART2_RX_BAT: R2.1 U19.87 U24.1
RSTN: U19.4
SENSOR_A: F3.2 U5.1 U7.1 U8.1 U9.1 U10.1 U11.1
SENSOR_B: F4.2 U5.2 U7.2 U8.2 U9.2 U10.2 U11.2
SWCLK: H1.3 U19.76
SWDIO: H1.4 U19.72
USB3_D+: R63.2 USB1.6 USB1.8
USB3_D-: R64.1 USB1.5 USB1.7
W1: U14.3
W2: U16.3
W3: U18.3
W4: U15.3
W5: U17.3
Y1: U14.1
Y2: U16.1
Y3: U18.1
Y4: U15.1
Y5: U17.1
$3N697: C107.1 U19.8 X2.2
$3N698: C108.1 U19.9 X2.1
$3N900: C109.2 U19.12 X3.3
$3N913: C110.2 U19.13 X3.1
$3N1102: R18.2 U19.94
$3N27755: C141.1 C142.1 R38.2 U19.20
$3N37466: R40.2 U19.37
$3N43765: C166.1 U19.73
$3N43824: C167.1 U19.49
$4N5491: D18.6 R63.1
$4N5566: D18.4 R64.2
$4N5769: D18.1 R66.2 R67.1
$4N5773: D18.3 R65.2
$4N5919: R14.2 USB1.10
$4N5920: R15.2 USB1.4
$5N582: Q1.3 R70.2 U24.2 U24.3
$5N1333: D19.1 D21.2 F2.1 R71.1 R73.2 U24.7
$5N1784: D20.1 D21.1 F1.1 R72.1 R73.1 U24.6
$5N3154: C169.2 U25.1
$5N3161: C170.2 U26.1
$5N3166: C171.2 U27.1
$5N6846: Q1.1 R68.2 R69.2
$5N6850: C1.2 U28.1
$5N6855: D4.1 D5.1 F3.1 R6.1 R7.1 U1.6
$5N6860: D3.1 D5.2 F4.1 R5.1 R7.2 U1.7
$5N6865: Q4.1 R1.2 R3.2
$5N6867: Q4.3 R4.2 U1.2 U1.3
$5N6961: Q2.3 Q3.1 R9.1 R10.1
$9N4816: LED2.1 R16.2
$9N50400: D8.1 Q8.4 R12.2
$9N50406: D1.1 D1.3 D2.1 D2.3 D16.2 R82.2 R83.2 U13.2
$9N50407: U2.2 U13.1
$9N50408: C177.2 R83.1
$9N50445: R13.1 U21.3
$9N50446: R17.1 U21.7
$9N50450: C15.2 U21.2
$9N50451: C15.1 L2.1 U21.1
$9N50452: R19.1 R20.2 U21.5
$9N50454: C21.2 U21.6
$9N50457: C21.1 R21.2

Pads without a net: U19 1 2 5 6 7 15 16 17 18 23 24 25 29 32 33 34 35 36 38 39 40 41 42 43 44 45 46 51 54 56 57 58 59 60 61 62 63 64 65 66 77 80 81 82 83 84 85 88 89 90 91 92 93 95 96 97 98; USB1 3 9 13 14

## Via types
v1: diameter 0.61, hole 0.305, Top Layer to Bottom Layer, 302 vias
v2: diameter 0.8, hole 0.5, Top Layer to Bottom Layer, 1 via
v3: diameter 0.7, hole 0.4, Top Layer to Bottom Layer, 1 via

## Routing (per net, layer and track width the routed paths; a pad name or vN(x,y) marks a point on that pad's centre or on a via; arc(x,y) is an arc through that point)
3V3: length 83.2
  Top Layer w0.254: v1(37.08,33.52) C2.2 34.22,33.52 R70.1 ; U3.3 64.77,2.73 64.77,4.75 64.4,5.12 R76.2 ; v1(50.93,48.72) 51.28,48.72 51.66,48.34 U19.75 ; L3.1 66.8,16.81 v1(66.42,16.43) ; C24.2 64.27,8.43 ; C24.2 v1(61.66,14.02) ; C24.2 61.66,7.1 v1(61.59,7.04) ; U19.50 66.45,45.55 67.18,46.28 v1(67.18,49.07) ; R72.2 27.69,22.9 v1(27.69,22.91) ; v1(31.62,47.42) 31.62,46.03 R4.1 28.84,46.01 28.45,46.41 26.94,46.41 R6.2 ; U1.8 31.25,40.3 31.63,39.92 R8.2 31.62,38.4 v1(31.62,37.1) ; R67.2 25.39,53.91 v1(26.29,53.01) ; U24.8 33.66,25.32 34.04,25.71 R2.2 35.61,25.77 C168.2 v1(38.86,25.77) ; R77.2 v1(69.08,7.04) ; LED2.2 31.88,62.15 v2(31.62,62.41)
  Top Layer w0.5: v2(31.62,62.41) 31.62,76 29.08,78.54 3.3V.1 24.7,78.54 C112.2 C19.1 C20.1 20.32,78.85 U6.2
3V3_MCU: length 24.8
  Top Layer w0.254: L4.1 66.79,22.45 C18.2 66.93,20.32 L3.2 66.79,20.18 C140.2 64.45,20.12 v1(62.36,20.12) ; v1(56.39,28.88) 56.39,30.02 56.64,30.28 56.64,31.98 U19.11 ; U19.28 61.55,34.55 60.66,33.66 U19.19 60.66,29.85 60.45,29.64 v1(60.45,28.88) ; U19.100 47.72,33.55 v1(47.62,33.45)
5V0: length 71.9
  Top Layer w0.254: U9.3 3.86,31.99 C5.2 6.53,31.94 U11.3 12.39,31.94 C9.2 v1(14.1,32.12) ; v1(69.34,68.25) 77.09,76 77.09,82.98 76.33,83.74 R9.2 ; C193.1 v1(10.29,77.39) ; C192.2 12.06,77.52 v1(11.43,78.16) ; C6.2 12.39,47.31 U10.3 6.53,47.31 C7.2 6.42,47.31 U5.3 ; U7.3 3.94,39.55 9.77,39.55 U8.3 9.98,39.61 12.57,39.61 ; U4.3 33.26,5.08 C25.2 33.15,5.32 v1(33.15,6.53)
  Bottom Layer w0.254: v1(10.29,77.39) 10.29,75.23 9.14,74.09 9.14,70.28 10.54,68.89 v1(10.54,65.58) ; R19.2 v1(30.35,75.35)
  vias: v1(2.54,76.63) v1(2.92,75.49) v1(3.05,77.9) v1(4.44,78.28) v1(5,80) v1(5.84,77.78) v1(6.22,75.49) v1(6.35,76.63) v1(9.93,80) v1(15.24,80.19) v1(15.25,77.48) v1(18.54,75.36)
5VUSB: length 35.2
  Top Layer w0.254: 20.57,57.42 20.56,57.44 D18.5 ; 20.57,57.42 20.57,53.64 20.07,53.14 16.07,53.14 C164.2 11.11,53.07 9.13,55.06 8.09,55.06 ; 20.57,57.42 20.57,60.63 19.62,61.58 C165.2 11.58,61.58 9.87,59.87 8.1,59.87 USB1.2
12V0: length 11.5
  Top Layer w0.254: v1(76.45,31.78) 12V0.1 75.44,31.81 R39.2
  Top Layer w0.5: C22.2 74.87,90.54 76.02,91.69 CN3.2
  Bottom Layer w0.254: v1(40,68.5) 40.03,68.53 C14.2 ; v1(41.91,68.5) 41.83,68.58 C13.2 ; C12.2 38.28,68.56 v1(38.23,68.5)
  vias: v1(28.7,68.89) v1(29.46,67.74) v1(30.48,69.52) v1(44.83,72.31) v1(45.97,72.31) v1(47.23,72.31) v1(48.51,72.31) v1(49.93,75) v1(50.93,77.78) v1(53.72,77.27) v1(55.09,75) v1(56.41,77.27) v1(60.45,77.01) v1(61.59,74.59) v1(62.74,77.01) v1(65,75) v1(67.94,76.89) v1(69.11,74.59) v1(70.28,76.85) v1(86.35,61.06) v1(86.37,59.71) v1(86.53,77.04) v1(86.51,75.84) v1(86.63,45.39) v1(86.61,44.03) v1(86.59,29.52) v1(86.62,28.14) v1(86.62,13.54) v1(86.66,12.22)
12V0_IN:
  vias: v1(38.86,83.13) v1(41.66,83.11) v1(42.93,84.89) v1(43.05,80.95) v1(43.56,85.9) v1(44.58,80.95) v1(45.47,85.9) v1(46,80.95)
GND: length 296.5
  Top Layer w0.254: U19.27 68.03,34.05 68.71,34.72 v1(69.09,34.72) ; C111.1 18.29,80.76 v1(18.29,82.09) ; v1(76.45,88.32) 77.6,89.47 R26.1 ; v1(76.07,25.2) 76.71,25.2 77.09,24.82 77.09,17.7 77.98,16.81 C145.1 ; R3.1 v1(43.69,42.6) ; v1(51.05,24.69) 51.05,25.64 C108.2 ; C30.1 70.23,31.83 ; 70.23,31.83 70.25,31.81 R41.1 ; 70.23,31.83 v1(70.23,31.17) ; 75.43,85.46 75.44,85.45 v1(75.44,84.76) ; U5.4 6.38,46.06 C7.1 ; v1(35.43,5.26) C25.1 34.48,2.62 U4.4 ; 6.48,30.59 9.81,30.59 U11.4 12.54,30.69 C9.1 v1(12.57,29.77) ; 6.48,30.59 v1(6.48,29.64) ; 6.48,30.59 6.38,30.69 U9.4 ; 85.22,88.19 85.22,92 88.01,94.79 C1.1 ; v1(12.57,45.14) C6.1 12.54,46.06 U10.4 6.57,46.06 C7.1 ; C8.1 6.51,38.44 U7.4 ; C8.1 9.81,38.34 U8.4 10,38.34 C10.1 v1(12.57,37.52) ; C8.1 v1(6.6,37.52) ; v1(83.44,88.06) 83.44,89.08 83.1,89.42 C3.1 ; v1(9.81,52.98) 9.81,53.47 9.02,54.25 USB1.12 ; 30.09,31.1 30.03,31.04 v1(29.34,31.04) ; C4.1 76.71,13 76.07,13.64 v1(76.07,23.8) ; v1(51.93,48.96) 52.16,48.73 U19.74 ; C24.1 60.13,8.31 v1(58.93,8.31) ; v1(19.81,48.82) D4.2 18.16,48.87 v1(18.16,50.72) ; v1(48.01,34.47) 48.01,34.3 48.26,34.05 U19.99 ; U24.5 v1(29.84,25.32) ; C19.2 22.67,77.14 v1(23.62,77.14) 23.68,77.2 C112.1 v1(25.65,77.2) ; C19.2 22.61,76.25 22.22,75.87 19.43,75.87 19.01,76.29 U6.1 20.32,76.95 C20.2 21.53,77.2 v1(21.59,77.27) 21.66,77.2 C19.2 ; C18.1 66.93,25.45 v1(66.04,26.34) ; R40.1 v1(68.83,41.71) ; v1(13.97,55.68) 13.97,54.54 R14.1 15.94,54.53 C164.1 v1(17.27,54.47) ; C147.1 v1(79.25,64.31) ; U19.10 v1(56.16,33.58) ; C7.1 v1(6.48,45.01) ; R69.1 v1(28.32,30.53) ; C168.1 v1(37.47,28.12) ; v1(10.29,72.95) C193.2 v1(11.18,74.03) C192.1 ; USB1.1 9.18,60.66 9.86,61.34 v1(10.03,61.34) ; v1(86.49,70.92) 86.49,69.27 87.44,68.31 v1(87.44,67.15) ; v1(86.61,55.03) 87.51,54.13 v1(87.51,51.41) ; C2.1 v1(36.07,31.29) ; 87.38,19.86 87.38,22.55 v1(86.64,23.28) ; U1.4 v1(36.58,44.11) ; C110.1 59.06,26.02 v1(59.06,25.07) ; C171.1 v1(71.5,5) ; v1(87.25,83.11) 87.25,85.52 85.98,86.79 v1(83.44,86.79) ; C148.1 v1(78.99,48.69) ; R16.1 v1(35.45,60.11) ; D19.2 v1(38.1,7.93) ; C140.1 v1(64.52,18.09) ; C169.1 4.95,83.74 6.22,82.47 v1(13.59,82.47) ; D18.2 v1(22.86,57.44) ; v1(86.72,39.32) 87.25,38.78 v1(87.25,35.61) ; C167.2 v1(68.83,47.55) ; 53.02,25.71 v1(53.02,24.69) ; v1(18.11,33.96) D3.2 v1(19.56,35.74) ; R82.1 29.97,94.79 ; U1.5 v1(28.19,44.11) ; R71.2 v1(37.08,21.51) ; C107.2 v1(45.4,24.69) ; C29.1 v1(83.57,25) ; v1(79.88,40.82) 82.11,40.82 C28.1 v1(83.69,40.88) ; 26.92,38.28 v1(26.92,37.39) ; C170.1 v1(15.49,5) ; v1(56.39,24.82) 56.39,23.8 X3.2 56.22,23.13 X3.4 54.61,21.34 v1(54.61,20.24) ; C146.1 v1(78.99,32.94) ; R10.2 v1(75.95,82.05) ; C166.2 v1(48.9,50.22) ; D20.2 v1(24.89,7.93) ; 39.38,42.53 v1(39.38,43.36) ; 81.47,80.57 v1(80.39,80.57) ; R18.1 v1(46.74,34.21) ; U24.4 v1(29.84,27.74) ; C165.1 v1(17.02,60.18) ; R15.1 v1(14.86,59.49) ; R38.1 v1(63.25,22.3)
  Top Layer w0.5: Q3.2 v3(72.64,87.36)
  Bottom Layer w0.254: 38.28,70.71 38.28,71.71 ; R21.1 v1(37.59,72.82) ; R20.1 33.93,76.23 v1(33.91,76.25) ; R17.2 v1(37.34,70.92) ; 23.52,73.46 v1(23.52,74.22) ; v1(21.07,80.25) 21.06,80.24 C16.1 19.77,77.52 C17.1 21.38,77.48 v1(21.59,77.27) ; 41.83,70.71 v1(41.83,71.71) ; C14.1 v1(40.03,71.71)
  vias: v1(2.54,72.31) v1(2.92,73.47) v1(3.05,71.42) v1(6.22,73.58) v1(6.22,71.42) v1(6.6,72.44) v1(10,20) v1(13.14,95.09) v1(13.59,92.76) v1(14.73,98.22) v1(19.05,98.48) v1(19.93,20) v1(20,30) v1(20.45,92.76) v1(20.84,95.09) v1(31.62,97.08) v1(34.66,99.05) v1(34.66,94.57) v1(35,50) v1(37.29,97.05) v1(38.28,71.71) v1(40,45) v1(45,30) v1(45,20) v1(45.21,95.05) v1(45.59,96.44) v1(45.59,93.65) v1(46.99,96.95) v1(46.99,93.14) v1(48.39,96.44) v1(48.39,93.78) v1(48.9,95.05) v1(49.95,10) v1(50,20) v1(50.93,81.1) v1(51.69,95.05) v1(52.07,96.32) v1(52.2,93.78) v1(53.47,96.83) v1(53.47,93.14) v1(53.72,82.86) v1(54.86,96.32) v1(54.86,93.65) v1(55.25,95.05) v1(56.35,82.86) v1(60,90) v1(60.45,82.22) v1(61.59,84.45) v1(62.72,82.22) v1(63.5,1.32) v1(65,95) v1(64.97,90) v1(67.94,82.22) v1(69.09,84.41) v1(70.23,82.22) v1(86.47,72.2) v1(86.58,24.62) v1(86.66,56.24) v1(86.68,40.65) v1(87.4,19.66) v1(93.98,94.54) v1(104.73,94.54)
V1:
  vias: v1(115.82,83.2) v1(115.82,81.38)
V2:
  vias: v1(115.79,51.31) v1(115.79,49.7)
V3:
  vias: v1(115.81,19.18) v1(115.81,17.57)
V4:
  vias: v1(115.82,67.16) v1(115.82,65.55)
V5:
  vias: v1(115.77,35.31) v1(115.77,33.7)
VDDA: length 11.2
  Top Layer w0.254: U19.22 U19.21 61.66,30.59 62.28,29.98 C141.2 C142.2 64.34,24.08 64.64,24.38
BAT_A: length 9.4
  Top Layer w0.254: F1.2 30.74,10.49 CN12.2 30.74,2.61 U4.1
BAT_ADC: length 9
  Top Layer w0.254: R39.1 R41.2 70.25,33.32 C30.2 70.14,33.33 68.93,33.33 BAT_TEST.1 65.24,33.58 U19.26
BAT_B: length 10.1
  Top Layer w0.254: F2.2 33.66,10.34 33.27,9.96 32.51,9.96 31.99,9.44 CN12.1 31.99,2.61 U4.2
I2C2_SCL: length 10
  Top Layer w0.254: v1(66.04,9.96) 66.04,8.57 R76.1 66.03,8.31 U3.2 ; v1(67.18,43.1) 67.18,43.61 66.75,44.05 U19.47
I2C2_SDA: length 10.9
  Top Layer w0.254: v1(68.07,43.61) 67.14,44.55 U19.48 ; v1(67.56,10.21) 67.56,8.44 R77.1 67.57,6.79 67.31,6.53 67.31,2.75 U3.1
KEY: length 14.9
  Top Layer w0.254: D7.2 51.66,88.7 R12.1 50.01,88.68 47.75,88.68 47.71,88.64 C11.1 45.4,88.7 R11.1 43.56,90.47 42.98,91.06 42.98,95.05
LED_R: length 10.9
  Top Layer w0.5: CN3.1 73.41,93.83 73.41,89.14 C22.1 72.14,89.08 71.65,88.6 Q3.3
LED_RIGHT: length 54.6
  Top Layer w0.254: R26.2 79.28,87.93 LED_RIGHT.1 79.25,86.3 79.25,85.01 77.85,83.62 77.85,75.62 61.21,58.98 61.21,55.8 61.66,55.36 U19.55 ; R26.2 77.37,87.96 76.84,87.43 75.5,87.43 75.43,87.36 ; R26.2 81.14,87.96 C3.2
MOTO1_PWM_TIM3_CH1: length 18.9
  Top Layer w0.254: C146.2 81.85,34.53 80.33,36.06 65.22,36.06 U19.31
MOTO2_PWM_TIM1_CH1: length 37.3
  Top Layer w0.254: v1(60.32,56.44) 55.66,51.77 U19.67 ; v1(62.1,56.44) 76.58,56.44 81.47,51.55 C148.2
  Bottom Layer w0.254: v1(62.1,56.44) v1(60.32,56.44)
MOTO3_PWM_TIM2_CH1: length 31.5
  Top Layer w0.254: C145.2 82.23,19.16 77.72,23.67 77.72,32.82 74.99,35.55 U19.30
MOTO4_PWM_TIM1_CH3: length 47.7
  Top Layer w0.254: MOTO4_PWM.1 84.59,80.43 ; v1(60.32,58.47) 54.66,52.8 U19.69 ; C149.2 82.87,79.24 82.3,78.66 79.5,78.66 78.49,77.65 78.49,75.11 v1(61.84,58.47)
  Bottom Layer w0.254: v1(61.84,58.47) v1(60.32,58.47)
MOTO5_PWM_TIM1_CH2: length 37.4
  Top Layer w0.254: v1(60.45,57.58) 55.16,52.29 U19.68 ; C147.2 81.73,63.23 81.15,62.66 67.56,62.66 v1(62.48,57.58)
  Bottom Layer w0.254: v1(62.48,57.58) v1(60.45,57.58)
NRST: length 2.3
  Top Layer w0.254: U19.14 58.16,30.41 v1(58.67,29.9)
OTG_FS_DM: length 37.4
  Top Layer w0.254: U19.70 54.16,53.97 49.91,58.22 R65.1
OTG_FS_DP: length 36.1
  Top Layer w0.254: U19.71 53.7,47.14 53.7,53.66 50.8,56.57 R66.1
PC10_UART4_TX: length 9.2
  Top Layer w0.254: U19.78 47.55,44.55 43.69,40.69 R1.1
PC11_UART4_RX: length 20.8
  Top Layer w0.254: U19.79 47.93,44.05 43.31,39.42 38.61,39.42 37.73,40.3 U1.1 33.64,40.3 33.27,39.93 33.27,38.54 R8.1
PD5_UART2_TX_BAT: length 20.9
  Top Layer w0.254: U19.86 45.96,40.55 40.13,34.72 R68.1
PD6_UART2_RX_BAT: length 24.5
  Top Layer w0.254: U19.87 46.73,40.05 35.56,28.88 R2.1 35.55,27.23 34.16,27.23 33.66,27.74 U24.1
SENSOR_A: length 50.7
  Top Layer w0.254: v1(13.84,40.31) 13.84,35.61 12.67,34.44 U11.1 U9.1 ; v1(13.84,42.72) 14.1,42.72 14.73,43.36 14.73,44.3 14.8,44.36 ; U7.1 U8.1 11.78,42.19 13.96,44.36 14.8,44.36 ; 14.8,44.36 F3.2 16.28,49.05 15.52,49.81 U10.1 U5.1
  Bottom Layer w0.254: v1(13.84,40.31) v1(13.84,42.72)
SENSOR_B: length 49.1
  Top Layer w0.254: 14.48,40.94 15.76,40.94 F4.2 16.26,40.4 16.26,35.36 14.09,33.19 U11.2 U9.2 ; 14.48,40.94 14.48,40.95 v1(14.48,41.71) ; 14.48,40.94 9.92,40.94 U8.2 U7.2 ; U5.2 U10.2 13.98,48.56 14.48,48.06 v1(14.48,47.04)
  Bottom Layer w0.254: v1(14.48,47.04) v1(14.48,41.71)
SWCLK: length 12.5
  Top Layer w0.254: H1.3 v1(43.94,52.5) ; v1(43.94,51.23) 43.94,49.71 48.13,45.52 50.08,45.52 U19.76
  Bottom Layer w0.254: v1(43.94,52.5) v1(43.94,51.23)
SWDIO: length 18.2
  Top Layer w0.254: H1.4 41.4,52.5 42.04,51.87 52.45,51.87 53.16,51.16 U19.72
USB3_D+: length 10.9
  Top Layer w0.254: USB1.6 10.29,57.7 10.47,57.53 10.47,56.77 10.4,56.7 ; 10.4,56.7 USB1.8 ; 10.4,56.7 15.49,56.7 R63.2
USB3_D-: length 11.7
  Top Layer w0.254: R64.1 8.1,58.22 USB1.5 6.59,58.2 6.35,57.96 6.35,57.45 6.6,57.2 USB1.7
W1:
  vias: v1(115.82,79.25) v1(115.82,77.57)
W2:
  vias: v1(115.74,47.37) v1(115.74,45.76)
W3:
  vias: v1(115.81,15.24) v1(115.81,13.63)
W4:
  vias: v1(115.79,62.86) v1(115.79,61.25)
W5:
  vias: v1(115.77,31.37) v1(115.77,29.76)
Y1:
  vias: v1(115.82,86.92) v1(115.82,85.15)
Y2:
  vias: v1(115.79,55.18) v1(115.79,53.57)
Y3:
  vias: v1(115.79,23.05) v1(115.79,21.44)
Y4:
  vias: v1(115.82,70.79) v1(115.82,69.18)
Y5:
  vias: v1(115.77,39.18) v1(115.77,37.57)
$3N697: length 15.9
  Top Layer w0.254: X2.2 46.86,25.52 C107.1 46.8,28.06 47.75,29.01 54.23,29.01 55.12,29.9 55.12,31.96 U19.8
$3N698: length 13.2
  Top Layer w0.254: X2.1 49.59,23.6 C108.1 49.59,27.04 51.05,28.5 54.48,28.5 55.63,29.64 55.63,31.97 U19.9
$3N900: length 10
  Top Layer w0.254: U19.12 57.16,28.38 56.01,27.23 55.25,27.23 54.42,26.41 C109.2 54.52,25.6 X3.3
$3N913: length 12.9
  Top Layer w0.254: X3.1 57.83,21.43 58.55,22.15 58.55,24.18 57.59,25.13 57.59,26.09 57.66,26.15 U19.13
$3N1102: length 3.4
  Top Layer w0.254: U19.94 46.79,36.55 R18.2
$3N27755: length 9.8
  Top Layer w0.254: R38.2 60.88,22.35 C142.1 C141.1 61.16,26.26 U19.20
$3N37466: length 3.7
  Top Layer w0.254: U19.37 68.71,39.05 R40.2
$3N43765: length 3.9
  Top Layer w0.254: 51.63,50.22 52.2,50.22 52.66,49.75 U19.73
$3N43824: length 3.6
  Top Layer w0.254: U19.49 68.81,45.05 C167.1
$4N5491: length 2.4
  Top Layer w0.254: R63.1 19.39,56.57 D18.6
$4N5566: length 2.4
  Top Layer w0.254: D18.4 18.58,58.39 18.42,58.22 R64.2
$4N5769: length 3.8
  Top Layer w0.254: D18.1 23.8,56.48 R66.2 R67.1
$4N5773: length 2.2
  Top Layer w0.254: D18.3 23.72,58.39 R65.2
$4N5919: length 4.8
  Top Layer w0.254: USB1.10 9.24,55.7 10.41,54.53 R14.2
$4N5920: length 4.7
  Top Layer w0.254: R15.2 10.29,59.49 9.5,58.7 USB1.4
$5N582: length 5.9
  Top Layer w0.254: R70.2 32.4,32.06 Q1.3 32.39,32.05 U24.2 U24.3
$5N1333: length 15.9
  Top Layer w0.254: U24.7 32.39,21.76 R73.2 R71.1 34.55,18.68 D21.2 34.21,15.27 F2.1 37.98,14.72 D19.1
$5N1784: length 16.1
  Top Layer w0.254: D20.1 29.6,14.83 F1.1 29.72,17.65 D21.1 29.2,18.51 R72.1 R73.1 31.12,23.69 U24.6
$5N3154: length 15.5
  Top Layer w0.254: U25.1 3.53,93.27 3.53,93.74 3.07,94.2 3.07,95.8 3.53,96.26 U25.1 4.12,96.85 4.2,96.93 6.39,96.93 U25.1 6.53,96.2 6.93,95.8 6.93,93.62 U25.1 4.95,91.64 C169.2
$5N3161: length 16.4
  Top Layer w0.254: 3.53,6.85 3.47,6.78 3.47,6.2 3.07,5.8 3.07,4.2 3.47,3.8 U26.1 3.53,3.15 4.12,3.15 4.2,3.07 5.8,3.07 5.88,3.15 6.47,3.15 6.53,3.22 6.53,3.8 6.93,4.2 6.93,5.8 6.53,6.2 U26.1 8.32,5 C170.2
$5N3166: length 15.6
  Top Layer w0.254: U27.1 126.72,3.62 126.72,5.8 126.32,6.2 U27.1 125.73,6.79 125.59,6.93 123.99,6.93 123.86,6.79 123.38,6.79 U27.1 123.33,6.26 122.86,5.8 122.86,4.2 123.33,3.74 123.33,3.27 U27.1 121.47,5 C171.2
$5N6846: length 3.5
  Top Layer w0.254: R68.2 30.11,33.02 30.02,32.94 R69.2
$5N6850: length 14.4
  Top Layer w0.254: U28.1 121.68,94.79 C1.2 ; U28.1 123.26,93.8 122.86,94.2 122.86,95.8 123.26,96.2 123.26,96.78 U28.1 123.91,96.85 123.99,96.93 125.59,96.93 125.67,96.85 126.27,96.85 U28.1 ; U28.1 123.32,93.15 123.91,93.15 123.99,93.07 125.59,93.07 125.67,93.15 U28.1
$5N6855: length 16.4
  Top Layer w0.254: 26.88,44.83 R6.1 ; 26.88,44.83 26.8,44.75 25.65,44.75 25.36,45.05 D5.1 ; 26.88,44.83 R7.1 27.78,43.01 28.07,42.72 29.48,42.72 U1.6 ; D5.1 23.17,45.01 21.08,45.01 20.44,44.36 F3.1 ; D5.1 23.29,45.13 D4.1
$5N6860: length 16.4
  Top Layer w0.254: D5.2 26.84,39.87 R5.1 26.92,41.46 R7.2 26.94,41.57 U1.7 ; D5.2 21.27,39.87 20.71,40.43 F4.1 ; D5.2 23.29,39.79 D3.1
$5N6865: length 3.6
  Top Layer w0.254: 39.38,40.63 40.97,40.63 R1.2 R3.2
$5N6867: length 8.1
  Top Layer w0.254: R4.2 33.11,43.36 33.63,42.84 U1.3 U1.2 37.07,41.57 Q4.3
$5N6961: length 8.2
  Top Layer w0.254: R10.1 R9.1 73.76,85.33 Q3.1 73.63,85.88 74.17,86.41 Q2.3
$9N4816: length 2.1
  Top Layer w0.254: LED2.1 37.86,62.12 R16.2
$9N50400: length 9.9
  Top Layer w0.254: 50.03,87.19 48.28,87.19 47.75,86.67 D8.1 47.75,84.38 v1(48.51,83.62)
  Bottom Layer w0.254: v1(48.51,83.62) Q8.4
$9N50406:
  vias: v1(28.11,90) v1(28.45,85.27) v1(29.97,90) v1(31.24,87.55) v1(34.54,86.54) v1(34.54,84.76) v1(34.54,81.46) v1(34.54,79.55)
$9N50407:
  vias: v1(13.14,87.94) v1(13.59,90.22) v1(14.1,85.27) v1(17.19,84.1) v1(20.7,90.09) v1(20.73,87.94) v1(20.83,85.27) v1(23.7,90.48) v1(23.7,85.11)
$9N50408: length 1.9
  Top Layer w0.254: R83.1 28.01,92.7 C177.2
$9N50445: length 4.2
  Bottom Layer w0.254: v1(25.53,67.61) 26.93,67.61 R13.1 ; v1(20.95,72.19) U21.3
$9N50446: length 5.9
  Bottom Layer w0.254: R17.1 U21.7
$9N50450: length 2.8
  Bottom Layer w0.254: C15.2 20.89,70.66 21.97,70.66 22.22,70.92 U21.2
$9N50451:
  vias: v1(13.59,69.14) v1(13.59,67.87) v1(18.92,69.14) v1(18.92,67.61) v1(20.83,67.87) v1(22.1,69.39) v1(23.52,68.76)
$9N50452: length 5.1
  Bottom Layer w0.254: 29.06,73.46 30.61,73.46 30.99,73.84 32.12,73.84 R19.1 32.2,73.78 33.93,73.78
$9N50454: length 7.7
  Bottom Layer w0.254: 35.81,73.77 35.81,73.2 34.8,72.19 U21.6
$9N50457: length 1.8
  Bottom Layer w0.254: C21.1 35.83,75.23 R21.2

## Copper pours and planes (outline as drawn; the poured copper is in the pictures)
5V0 on Top Layer: 18.72,73.33 14.1,73.33 12.57,74.85 2.16,74.85 1.52,75.49 1.52,81.08 2.29,81.84 17.14,81.84 17.4,81.58 17.4,76.38 17.91,75.87 18.67,75.87 19.18,75.36 19.18,73.79
5V0 on Bottom Layer: 18.72,73.33 14.1,73.33 12.57,74.85 2.16,74.85 1.52,75.49 1.52,81.08 2.29,81.84 17.14,81.84 17.4,81.58 17.4,76.38 17.91,75.87 18.67,75.87 19.18,75.36 19.18,73.79
5V0 on In2.Cu: 18.72,73.33 14.1,73.33 12.57,74.85 2.16,74.85 1.52,75.49 1.52,81.08 2.29,81.84 17.14,81.84 17.4,81.58 17.4,76.38 17.91,75.87 18.67,75.87 19.18,75.36 19.18,73.79
12V0 on Top Layer: 80.77,14.4 88.76,14.4 88.76,11.5 80.77,11.5
12V0 on Top Layer: 84.12,46.1 88.85,46.1 88.85,43.25 84.12,43.25
12V0 on Top Layer: 83.99,61.85 88.75,61.85 88.75,59 83.99,59
12V0 on Top Layer: 81.03,61.9 88.75,61.9 88.75,59 81.03,59
12V0 on Top Layer: 81.03,46.13 88.85,46.13 88.85,43.25 81.03,43.25
12V0 on Top Layer: 70.61,79.3 71.88,78.03 71.88,73.2 69.09,70.41 44.96,70.41 44.33,71.04 44.33,77.91 44.45,78.03 49.28,78.03 50.55,79.3
12V0 on Top Layer: 80.93,77.81 88.85,77.81 88.85,74.95 80.93,74.95
12V0 on Top Layer: 84,14.35 88.76,14.35 88.76,11.5 84,11.5
12V0 on Top Layer: 80.77,30.28 88.85,30.28 88.85,27.5 80.77,27.5
12V0 on Bottom Layer: 44.32,77.9 44.45,78.03 49.28,78.03 50.55,79.3 70.61,79.3 71.88,78.03 71.88,71.55 70.74,70.41 48.9,70.41 45.08,66.6 28.32,66.6 27.91,67.01 27.91,69.62 28.32,70.03 43.56,70.03 44.32,70.79
12V0 on In2.Cu: 44.32,77.9 44.45,78.03 49.28,78.03 50.55,79.3 70.61,79.3 71.88,78.03 71.88,73.84 68.45,70.41 48.9,70.41 45.08,66.6 28.32,66.6 27.91,67.01 27.91,69.62 28.32,70.03 43.56,70.03 44.32,70.79
12V0 on In2.Cu: 60.83,98.86 61.98,97.71 61.98,87.3 62.87,86.41 73.39,86.41 74.34,87.36 74.34,97.63 75.56,98.86 79.88,98.86 81.03,97.71 81.03,78.41 81.66,77.78 88.85,77.78 88.85,74.95 81.66,74.95 81.66,61.9 88.75,61.9 88.75,59 81.66,59 81.66,46.15 88.85,46.15 88.85,43.25 81.66,43.25 81.66,30.28 88.85,30.28 88.85,27.5 82.31,27.5 81.66,26.85 81.66,14.4 88.76,14.4 88.76,11.48 75.31,11.48 75.31,68.12 73.03,70.41 55.91,70.41 55.5,70.82 55.5,98.35 56.01,98.86
12V0_IN on Top Layer: 37.6,87.27 37.98,87.65 45.87,87.65 46.18,87.34 46.18,85.19 47.75,83.62 47.75,79.05 47.37,78.66 38.23,78.66 37.6,79.3
12V0_IN on Bottom Layer: 37.6,87.27 37.98,87.65 45.87,87.65 46.18,87.34 46.18,85.19 47.75,83.62 47.75,79.05 47.37,78.66 38.23,78.66 37.6,79.3
12V0_IN on In1.Cu: 37.6,87.27 37.98,87.65 45.87,87.65 46.18,87.34 46.18,85.19 47.75,83.62 47.75,79.05 47.37,78.66 38.23,78.66 37.6,79.3
12V0_IN on In2.Cu: 37.6,87.27 37.98,87.65 45.87,87.65 46.18,87.34 46.18,85.19 47.75,83.62 47.75,79.05 47.37,78.66 38.23,78.66 37.6,79.3
GND on Top Layer: 82.55,88.82 88.84,88.82 88.84,86.03 82.55,86.03
GND on Top Layer: 86.07,20.33 88.72,20.33 88.72,18.98 86.07,18.98
GND on Top Layer: 86.07,20.33 88.72,20.33 88.72,18.98 86.07,18.98
GND on Top Layer: 81.03,57.2 88.85,57.2 88.85,54.33 81.03,54.33
GND on Top Layer: 80.89,73.02 88.72,73.02 88.72,70.08 80.89,70.08
GND on Top Layer: 84.05,41.44 88.82,41.44 88.82,38.58 84.05,38.58
GND on Top Layer: 12.48,89.5 12.48,95.49 13.48,96.48 63.87,96.48 67.09,93.26 67.09,85.56 71.79,80.86 71.79,78.07 70.52,76.8 52.56,76.8 51.92,76.16 50.33,76.16 50.08,76.42 50.08,78.07 53.5,81.5 53.5,86.28 50.67,89.12 41.69,89.12 40.68,90.13 25.18,90.13 23.53,88.48 13.5,88.48
GND on Top Layer: 83.97,25.44 88.73,25.44 88.73,22.58 83.97,22.58
GND on Top Layer: 86.19,52.08 88.84,52.08 88.84,50.73 86.19,50.73
GND on Top Layer: 86.18,83.79 88.82,83.79 88.82,82.43 86.18,82.43
GND on Top Layer: 86.16,36.34 88.81,36.34 88.81,34.98 86.16,34.98
GND on Top Layer: 84.07,88.89 88.84,88.89 88.84,86.03 84.07,86.03
GND on Top Layer: 80.77,25.58 88.73,25.58 88.73,22.58 80.77,22.58
GND on Top Layer: 86.16,36.34 88.81,36.34 88.81,34.98 86.16,34.98
GND on Top Layer: 80.92,41.51 88.87,41.51 88.87,38.51 80.92,38.51
GND on Top Layer: 86.07,20.33 88.85,20.33 88.85,18.98 86.07,18.98
GND on Top Layer: 86.07,67.83 88.71,67.83 88.71,66.48 86.07,66.48
GND on Bottom Layer: 0,62.69 72.6,62.69 72.6,0 0,0
GND on Bottom Layer: 84.29,88.89 88.84,88.89 88.84,86.03 81.66,86.03 81.66,72.96 88.72,72.96 88.72,70.08 81.65,70.08 81.65,57.21 81.66,57.2 88.85,57.2 88.85,54.33 81.65,54.33 81.65,41.58 88.82,41.58 88.82,38.58 81.66,38.58 81.66,25.56 88.73,25.56 88.73,22.53 75.18,22.53 75.18,75.47 63.41,87.24 65,88.82 84.36,88.82
GND on Bottom Layer: 12.45,93.02 12.45,99 13.44,100 63.83,100 67.06,96.77 67.06,89.08 71.75,84.38 71.75,81.58 70.49,80.31 52.52,80.31 51.89,79.68 50.29,79.68 50.04,79.93 50.04,81.58 53.47,85.01 53.47,89.8 50.63,92.63 41.66,92.63 40.64,93.65 25.15,93.65 23.5,92 13.46,92
GND on In1.Cu: 12.45,93.02 12.45,99 13.44,100 63.83,100 67.06,96.77 67.06,89.08 71.75,84.38 71.75,81.58 70.49,80.31 52.52,80.31 51.89,79.68 50.29,79.68 50.04,79.93 50.04,81.58 53.47,85.01 53.47,89.8 50.63,92.63 41.66,92.63 40.64,93.65 25.15,93.65 23.5,92 13.46,92
GND on In1.Cu: 84.29,88.89 88.84,88.89 88.84,86.03 81.66,86.03 81.66,72.96 88.72,72.96 88.72,70.08 81.65,70.08 81.65,57.21 81.66,57.2 88.85,57.2 88.85,54.33 81.65,54.33 81.65,41.58 88.82,41.58 88.82,38.58 81.66,38.58 81.66,25.56 88.73,25.56 88.73,22.53 75.18,22.53 75.18,75.47 63.41,87.24 65,88.82 84.36,88.82
GND on In1.Cu: 1.57,73.63 2.16,74.22 8.51,74.22 12.45,78.16 12.45,98.98 13.46,100 23.11,100 24.13,98.98 24.13,84.51 30.3,78.33 43.54,78.33 44.01,77.86 44.01,70.86 43.43,70.28 36.07,70.28 35.94,70.41 35.94,71.68 37.08,72.82 37.08,74.35 37.21,74.47 37.97,74.47 38.35,74.85 38.35,75.74 38.05,76.04 35.3,76.04 35.1,75.84 35.1,74.91 34.92,74.73 33.4,74.73 33.19,74.94 33.19,75.96 33.02,76.12 29.08,76.12 27.31,74.35 27.31,70.47 25.34,70.47 25.27,70.54 25.27,72.81 25.01,73.07 22.74,73.07 22.22,73.58 22.22,75.74 21.59,76.38 18.98,76.38 18.65,76.71 18.65,81.73 15.9,81.73 15.37,81.2 15.37,76.63 9.65,70.92 2.16,70.92 1.57,71.51
V1 on Top Layer: 111.84,83.81 128.73,83.81 128.73,80.63 111.84,80.63
V1 on In1.Cu: 111.84,83.81 128.73,83.81 128.73,80.63 111.84,80.63
V1 on In2.Cu: 111.84,83.81 128.73,83.81 128.73,80.63 111.84,80.63
V2 on Top Layer: 111.06,52.18 127.95,52.18 127.95,49.01 111.06,49.01
V2 on In1.Cu: 111.06,52.18 127.95,52.18 127.95,49.01 111.06,49.01
V2 on In2.Cu: 111.06,52.18 127.95,52.18 127.95,49.01 111.06,49.01
V3 on Top Layer: 111.06,20.05 127.95,20.05 127.95,16.88 111.06,16.88
V3 on In1.Cu: 111.06,20.05 127.95,20.05 127.95,16.88 111.06,16.88
V3 on In2.Cu: 111.06,20.05 127.95,20.05 127.95,16.88 111.06,16.88
V4 on Top Layer: 111.32,67.68 128.21,67.68 128.21,64.5 111.32,64.5
V4 on In1.Cu: 111.32,67.68 128.21,67.68 128.21,64.5 111.32,64.5
V4 on In2.Cu: 111.32,67.68 128.21,67.68 128.21,64.5 111.32,64.5
V5 on Top Layer: 111.19,36.18 128.08,36.18 128.08,33.01 111.19,33.01
V5 on In1.Cu: 111.19,36.18 128.08,36.18 128.08,33.01 111.19,33.01
V5 on In2.Cu: 111.19,36.18 128.08,36.18 128.08,33.01 111.19,33.01
MOTO1_PWM_TIM3_CH1 on Top Layer: 81.28,33.58 88.86,33.58 88.86,32.23 81.28,32.23
MOTO2_PWM_TIM1_CH1 on Top Layer: 81.17,49.32 88.89,49.32 88.89,47.98 81.17,47.98
MOTO3_PWM_TIM2_CH1 on Top Layer: 81.68,17.57 88.77,17.57 88.77,16.23 81.68,16.23
MOTO4_PWM_TIM1_CH3 on Top Layer: 82.23,81.16 88.88,81.16 88.88,79.68 82.23,79.68
MOTO5_PWM_TIM1_CH2 on Top Layer: 81.46,65.08 88.89,65.08 88.89,63.6 81.46,63.6
W1 on Top Layer: 111.82,79.87 128.71,79.87 128.71,76.7 111.82,76.7
W1 on In1.Cu: 111.82,79.87 128.71,79.87 128.71,76.7 111.82,76.7
W1 on In2.Cu: 111.82,79.87 128.71,79.87 128.71,76.7 111.82,76.7
W2 on Top Layer: 111.06,48.12 127.95,48.12 127.95,44.95 111.06,44.95
W2 on In1.Cu: 111.06,48.12 127.95,48.12 127.95,44.95 111.06,44.95
W2 on In2.Cu: 111.06,48.12 127.95,48.12 127.95,44.95 111.06,44.95
W3 on Top Layer: 111.06,15.99 127.95,15.99 127.95,12.81 111.06,12.81
W3 on In1.Cu: 111.06,15.99 127.95,15.99 127.95,12.81 111.06,12.81
W3 on In2.Cu: 111.06,15.99 127.95,15.99 127.95,12.81 111.06,12.81
W4 on Top Layer: 111.32,63.61 128.21,63.61 128.21,60.44 111.32,60.44
W4 on In1.Cu: 111.32,63.61 128.21,63.61 128.21,60.44 111.32,60.44
W4 on In2.Cu: 111.32,63.61 128.21,63.61 128.21,60.44 111.32,60.44
W5 on Top Layer: 111.19,32.12 128.08,32.12 128.08,28.94 111.19,28.94
W5 on In1.Cu: 111.19,32.12 128.08,32.12 128.08,28.94 111.19,28.94
W5 on In2.Cu: 111.19,32.12 128.08,32.12 128.08,28.94 111.19,28.94
Y1 on Top Layer: 111.89,87.68 128.78,87.68 128.78,84.51 111.89,84.51
Y1 on In1.Cu: 111.89,87.68 128.78,87.68 128.78,84.51 111.89,84.51
Y1 on In2.Cu: 111.89,87.68 128.78,87.68 128.78,84.51 111.89,84.51
Y2 on Top Layer: 111.06,55.99 127.95,55.99 127.95,52.82 111.06,52.82
Y2 on In1.Cu: 111.06,55.99 127.95,55.99 127.95,52.82 111.06,52.82
Y2 on In2.Cu: 111.06,55.99 127.95,55.99 127.95,52.82 111.06,52.82
Y3 on Top Layer: 111.06,23.86 127.95,23.86 127.95,20.69 111.06,20.69
Y3 on In1.Cu: 111.06,23.86 127.95,23.86 127.95,20.69 111.06,20.69
Y3 on In2.Cu: 111.06,23.86 127.95,23.86 127.95,20.69 111.06,20.69
Y4 on Top Layer: 111.32,71.49 128.21,71.49 128.21,68.31 111.32,68.31
Y4 on In1.Cu: 111.32,71.49 128.21,71.49 128.21,68.31 111.32,68.31
Y4 on In2.Cu: 111.32,71.49 128.21,71.49 128.21,68.31 111.32,68.31
Y5 on Top Layer: 111.19,39.99 128.08,39.99 128.08,36.82 111.19,36.82
Y5 on In1.Cu: 111.19,39.99 128.08,39.99 128.08,36.82 111.19,36.82
Y5 on In2.Cu: 111.19,39.99 128.08,39.99 128.08,36.82 111.19,36.82
$9N50406 on Top Layer: 26.91,91.62 36.58,91.62 36.58,78.92 26.91,78.92
$9N50406 on In2.Cu: 26.91,90.9 27.63,91.62 31.24,91.62 31.5,91.36 36.58,91.36 36.58,79.17 36.32,78.92 32.89,78.92 26.91,84.9
$9N50407 on Top Layer: 12.45,91.11 25.4,91.11 25.4,83.24 12.45,83.24
$9N50407 on In2.Cu: 12.45,91.11 25.4,91.11 25.4,83.24 12.45,83.24
$9N50451 on Top Layer: 13.59,69.9 24.48,69.9 25.02,69.36 25.02,67.62 24.26,66.85 13.72,66.85 13.08,67.49 13.08,69.39
$9N50451 on Bottom Layer: 13.59,69.9 24.48,69.9 25.02,69.36 25.02,67.62 24.26,66.85 13.72,66.85 13.08,67.49 13.08,69.39
$9N50451 on In1.Cu: 13.59,69.9 24.48,69.9 25.02,69.36 25.02,67.62 24.26,66.85 13.72,66.85 13.08,67.49 13.08,69.39

Small or netless copper shapes (teardrops, artwork), in the pictures only: 534 on Top Layer, 58 on Bottom Layer, 2 on In1.Cu, 47 on In2.Cu

## Text on the board
Top Silkscreen Layer: GND | 5V | 3.3V | SCL | SDA | KEY | 探照灯- | 12V | 探照灯+ | A | B | BAT | 温度传感器 | 深度传感器 | 超声波传感器 | 日期 | 版本 | 名称 | ROV_MINI_CTRL | 2026/5/28 | V_2.0.0
